# Altium schematic sheet 02_MosfetDrive_Stage.SchDoc
size A4; SheetNumber: 2; SheetTotal: 3
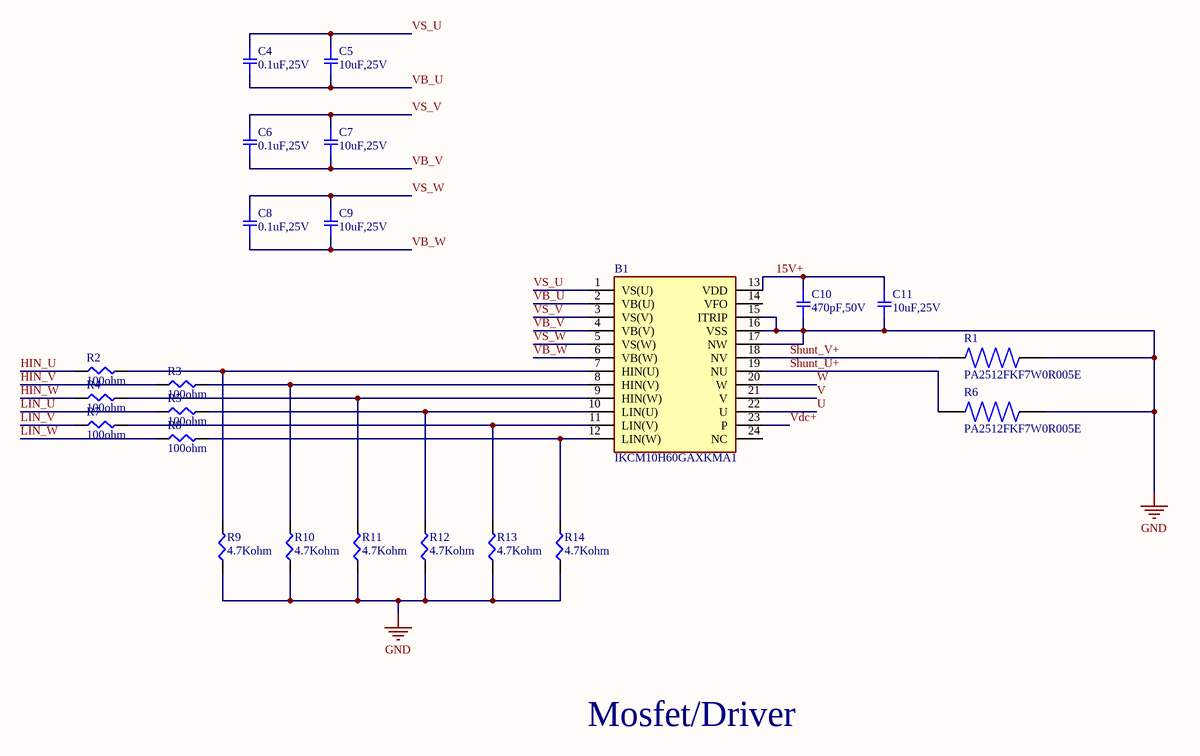
[diagram p0: 02_MosfetDrive_Stage.SchDoc]

## Parts
B1  IKCM10H60GAXKMA1  [997_IKCM10H60GAXKMA1]
C4  0.1uF,25V  [001_SMD-1206]
C5  10uF,25V  [001_SMD-1206]
C6  0.1uF,25V  [001_SMD-1206]
C7  10uF,25V  [001_SMD-1206]
C8  0.1uF,25V  [001_SMD-1206]
C9  10uF,25V  [001_SMD-1206]
C10  470pF,50V  [001_SMD-1206]
C11  10uF,25V  [001_SMD-1206]
R1  PA2512FKF7W0R005E  [097_PA2512FKF7W0R005E]
R2  100ohm  [001_SMD-1206]
R3  100ohm  [001_SMD-1206]
R4  100ohm  [001_SMD-1206]
R5  100ohm  [001_SMD-1206]
R6  PA2512FKF7W0R005E  [097_PA2512FKF7W0R005E]
R7  100ohm  [001_SMD-1206]
R8  100ohm  [001_SMD-1206]
R9  4.7Kohm  [001_SMD-1206]
R10  4.7Kohm  [001_SMD-1206]
R11  4.7Kohm  [001_SMD-1206]
R12  4.7Kohm  [001_SMD-1206]
R13  4.7Kohm  [001_SMD-1206]
R14  4.7Kohm  [001_SMD-1206]

## Nets
GND: B1.15(ITRIP) B1.16(VSS) B1.17(NW) C10.2 C11.2 R1.2 R6.2 R9.1 R10.1 R11.1 R12.1 R13.1 R14.1
15V+: B1.13(VDD) C10.1 C11.1
HIN_U: R2.1
HIN_V: R3.1
HIN_W: R4.1
LIN_U: R5.1
LIN_V: R7.1
LIN_W: R8.1
Shunt_U+: B1.19(NU) R6.1
Shunt_V+: B1.18(NV) R1.1
U: B1.22(U)
V: B1.21(V)
VB_U: B1.2(VB(U)) C4.2 C5.2
VB_V: B1.4(VB(V)) C6.2 C7.2
VB_W: B1.6(VB(W)) C8.2 C9.2
Vdc+: B1.23(P)
VS_U: B1.1(VS(U)) C4.1 C5.1
VS_V: B1.3(VS(V)) C6.1 C7.1
VS_W: B1.5(VS(W)) C8.1 C9.1
W: B1.20(W)
NetB1_7: B1.7(HIN(U)) R2.2 R9.2
NetB1_8: B1.8(HIN(V)) R3.2 R10.2
NetB1_9: B1.9(HIN(W)) R4.2 R11.2
NetB1_10: B1.10(LIN(U)) R5.2 R12.2
NetB1_11: B1.11(LIN(V)) R7.2 R13.2
NetB1_12: B1.12(LIN(W)) R8.2 R14.2

Not connected (* = marked no-connect by the designer): B1 14(VFO) 24(NC)

## Notes on the sheet
- Mosfet/Driver

## Library data of the parts
B1 = IKCM10H60GAXKMA1: Intelligent Power Module 3-Ph 600V 10A; Manufacturer_Name: Infineon; Geometry.Height: 5.6mm; Manufacturer_Part_Number: IKCM10H60GAXKMA1; Mouser Part Number: 726-IKCM10H60GAXKMA1; Mouser Price/Stock: https://www.mouser.co.uk/ProductDetail/Infineon-Technologies/IKCM10H60GAXKMA1?qs=hdSwu7a6m9Y5VjDgSjSs%2Fw%3D%3D; Arrow Part Number: IKCM10H60GAXKMA1; Arrow Price/Stock: https://www.arrow.com/en/products/ikcm10h60gaxkma1/infineon-technologies-ag; Datasheet Link: https://www.infineon.com/dgdl/Infineon-IKCM10H60GA-DS-v02_04-EN.pdf?fileId=5546d4624fb7fef2014fcb43a49a78bb
C4-C11 = C_1206_Template: CAP CER 1206; Part Number: GC321AD72E103KX01D; Manufacturer: Murata Electronics North America; Factory Stock: 0; Unit Price (USD): 0.3; Minimum Quantity: 1; Value: 10000pF; Tolerance: ±10%; Voltage: 250V; Temperature Coefficient: X7T; Datasheets: http://search.murata.co.jp/Ceramy/image/img/A01X/G101/ENG/GC321AD72E103KX01-01.pdf; Image: //media.digikey.com/Renders/Murata%20Renders/0805(GC3)200x125.jpg; Digi-Key Part Number: 490-13986-1-ND; Quantity Available: 4000; @ qty: 0; Packaging: Cut Tape (CT); Series: GC3; Part Status: Active; Operating Temperature: -55°C ~ 125°C; Features: -; Ratings: AEC-Q200; Applications: Automotive; Mounting Type: Surface Mount, MLCC; Package / Case: 0805 (2012 Metric); Size / Dimension: 0.079" L x 0.049" W (2.00mm x 1.25mm); Height - Seated (Max): -; Thickness (Max): 0.039" (1.00mm); Lead Spacing: -; Lead Style: -
R1 R6 = PA2512FKF7W0R005E: 5 mΩ, 2 W, ±1% current-sense shunt resistor, 2512 (6332 metric) SMD package, low-resistance metal-element construction.; MF: Bourns; MP: CRF2512-FZ-R005ELF; SnapEDA_Link: https://www.snapeda.com/parts/CRF2512-FZ-R005ELF/Bourns/view-part/?ref=snap; Package: 6432 Bourns; Value: *; Check_prices: https://www.snapeda.com/parts/CRF2512-FZ-R005ELF/Bourns/view-part/?ref=eda
R2-R5 R7-R14 = R_1206_Template: RES SMD 1206; Part Number: ERJ-8BQF1R0V; Manufacturer: Panasonic Electronic Components; Factory Stock: 0; Unit Price (USD): 0.05778; @ qty: 1500; Minimum Quantity: 1; Value: 1; Tolerance: ±1%; Power (Watts): 0.5W, 1/2W; Temperature Coefficient: ±200ppm/°C; Datasheets: https://industrial.panasonic.com/cdbs/www-data/pdf/RDA0000/AOA0000C239.pdf; Image: //media.digikey.com/Renders/Panasonic%20Renders/ERJ-1206%20Pkg.jpg; Digi-Key Part Number: P17600CT-ND; Quantity Available: 2046; Packaging: Cut Tape (CT); Series: ERJ; Part Status: Active; Composition: Thick Film; Features: Automotive AEC-Q200, Current Sense; Operating Temperature: -55°C ~ 125°C; Package / Case: 1206 (3216 Metric); Supplier Device Package: 1206; Size / Dimension: 0.126" L x 0.063" W (3.20mm x 1.60mm); Height - Seated (Max): 0.028" (0.70mm); Number of Terminations: 2; Failure Rate: -